# EasyEDA Pro project fei1554973967-sw3538-dff8db20.epro, board 充电板
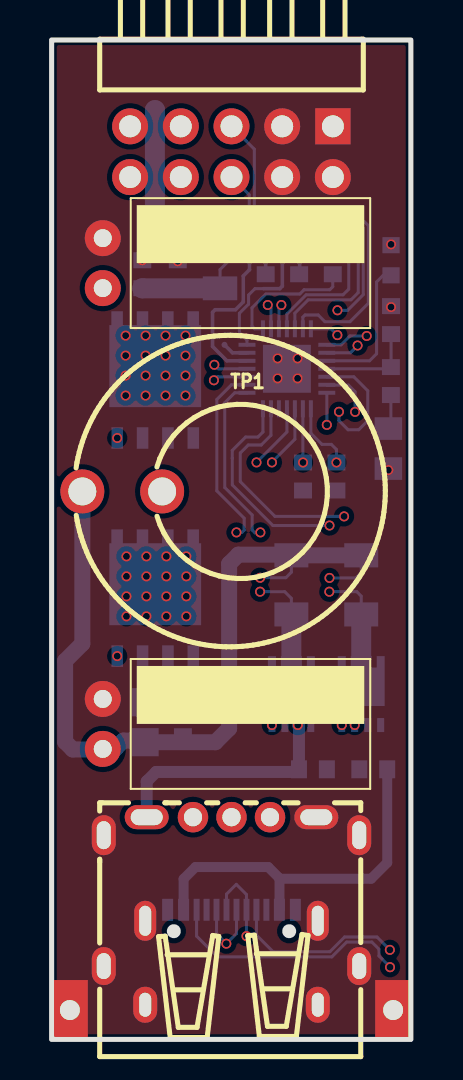
[diagram p3: board, top side]
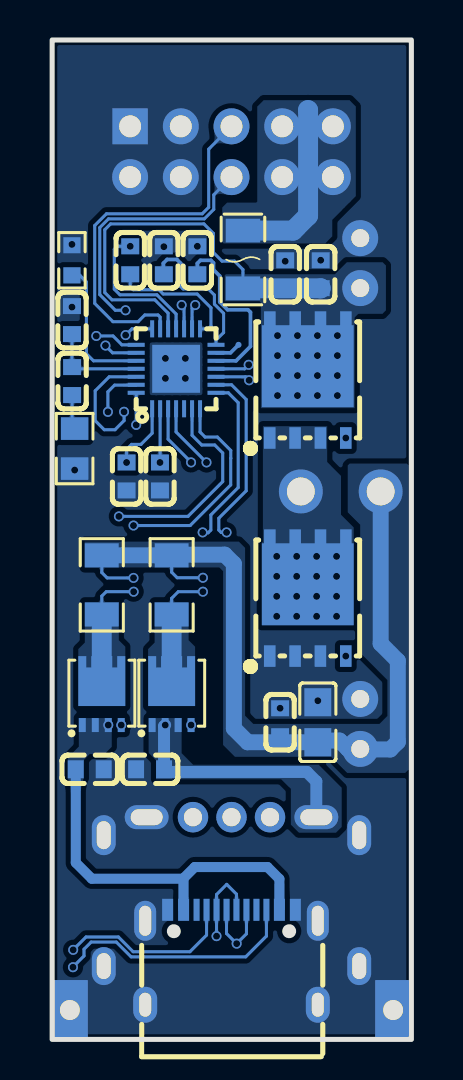
[diagram p4: board, bottom side, seen from below]

Outline 18 x 50 mm; copper layers: Top Layer, Inner1, Inner2, Bottom Layer. Coordinates in mm from the lower left corner of the outline.
Outline path: rectangle 0,50 18,0
Stack: Top Layer 0.035mm 外层铜厚1oz / Dielectric1 0.2104mm 7628 RC49% 8.6mil / Inner1 0.0152mm 内层铜厚 / Dielectric2 1.065mm 1.1mm H/HOZ Copper / Inner2 0.0152mm 内层铜厚 / Dielectric3 0.2104mm 7628 RC49% 8.6mil / Bottom Layer 0.035mm 外层铜厚1oz

## Design rules (mm)
spacing copperThickness1oz (default): track to track 0.1, other pairs 0 to 0.1
spacing copperThickness2oz: track to track 0.203, other pairs 0.152 to 0.3
spacing Plane_innerPlane: track to track 0.1, other pairs 0 to 0.1
spacing Copper_copperRegion: track to track 0.1, other pairs 0 to 0.1
track width copperThickness1oz (default): min 0.1, default 0.254, max 2.54
track width copperThickness2oz: min 0.203, default 0.254, max 2.54
differential pair differentialPair (default): width min 0.127, default 0.254, max 2.54; gap min 0.152, default 0.152
pour e543 uses Copper_copperRegion
pour e545 uses Copper_copperRegion
pour e547 uses Copper_copperRegion
pour e549 uses Copper_copperRegion

## Placement (name value [footprint] x y rotation side)
C1  330pF  [C0603]  14.27 28.16 270 bottom
C2  330pF  [C0603]  12.6 28.16 270 bottom
C3  100nF  [C0603]  4.54 38.28 90 bottom
C4  10uF  [C0603]  6.32 38.28 90 bottom
C5  220uF  [CAP-EL_D6.3X11MM-P2.5MM_W_DIP-X]  2.56 38.84 270 top
C6  100pF  [C0603]  17.01 35.99 90 bottom
C7  2.2nF  [C0603]  17 32.93 270 bottom
C8  10uF  [C0603]  16.12 13.51 0 bottom
C9  220uF  [CAP-EL_D6.3X11MM-P2.5MM_W_DIP-X]  2.56 15.78 270 top
C10  22uF  [C0805]  4.69 15.87 270 bottom
C11  100nF  [C0603]  6.58 15.87 270 bottom
C12  100nF  [C0603]  14.09 38.98 270 bottom
C13  10uF  [C0603]  13.09 13.51 180 bottom
C14  1uF  [C0603]  10.72 38.98 270 bottom
C15  1uF  [C0603]  12.4 38.98 270 bottom
F1  JFC1206-1500FS  [F1206]  8.44 39.02 90 bottom
H1  PZ254R-12-10P  [HDR-TH_10P-P2.54-H-M-R2-C5-S2.54]  9.01 44.41 180 top
L1  22uH  [IND-TH_BD15.5-P4.00-D0.8_XR050125TS221MHL5]  3.54 27.41 270 top
NOREF  -  [Pad_e80]  0.91 1.47 0 top
NOREF#2  -  [Pad_e81]  17.11 1.47 0 top
NTC1  SDNT1608X104F3950FTF  [R0603]  17.01 38.98 90 bottom
Q1  AON7544  [DFN-8_L3.3-W3.3-P0.65-BL-2]  15.51 16.49 180 bottom
Q2  AON6512  [PDFN-8_L5.6-W5.2-P1.27-LS6.1-BL]  5.19 32.99 180 bottom
Q3  AON6512  [PDFN-8_L5.6-W5.2-P1.27-LS6.1-BL]  5.19 22.08 180 bottom
Q4  AON7544  [DFN-8_L3.3-W3.3-P0.65-BL-2]  12.01 16.49 180 bottom
R1  20kΩ  [R0805]  16.87 29.56 270 bottom
TP1  -  [Test-Point-0.5mm]  8.66 34.75 0 top
U1  SW3538  [QFN-28_L4.0-W4.0-P0.40-TL-EP2.4]  11.79 33.55 90 bottom
U2  5mΩ  [R1206]  15.51 22.74 270 bottom
U3  5mΩ  [R1206]  12.01 22.74 270 bottom
USB1  TYPE-C 16PIN 2MD(073)  [USB-C-SMD_TYPE-C-6PIN-2MD-073]  9.01 4.11 180 bottom
USB2  U234-051N-3GRA035-5  [USB-A-TH_U234-051N-3GRA03]  9.01 7.39 0 top

## Footprints (pads in the part's own frame, mm; a bottom-side part is the same pattern mirrored in y, then rotated)
C0603
  rect 0.8x0.9 smd: 1(-0.7,0) 2(0.7,0)
C0805
  rect 1.41x1.35 smd: 1(-1,0) 2(1,0)
CAP-EL_D6.3X11MM-P2.5MM_W_DIP-X
  round 1.8 hole 0.9: 1(1.25,0) 2(-1.25,0)
DFN-8_L3.3-W3.3-P0.65-BL-2
  rect 0.35x0.7 smd: 1(-0.975,-0.765) 2(-0.325,-0.765) 3(0.325,-0.765) 4(0.975,-0.765)
  custom 2.352x2.498 smd: 5(0,0.765)
F1206
  rect 1.19x1.728 smd: 1(-1.445,0) 2(1.445,0)
HDR-TH_10P-P2.54-H-M-R2-C5-S2.54
  rect 1.778x1.8 hole 1.1: 1(-5.08,-1.27)
  round 1.8 hole 1.1: 2(-5.08,1.27) 3(-2.54,-1.27) 4(-2.54,1.27) 5(0,-1.27) 6(0,1.27) 7(2.54,-1.27) 8(2.54,1.27) 9(5.08,-1.27) 10(5.08,1.27)
IND-TH_BD15.5-P4.00-D0.8_XR050125TS221MHL5
  round 2.2 hole 1.4: 1(0,2) 2(0,-2)
Pad_e80
  rect 1.8x3 hole 1: 1(0,0)
Pad_e81
  rect 1.8x3 hole 1: 1(0,0)
PDFN-8_L5.6-W5.2-P1.27-LS6.1-BL
  rect 0.58x1.079 smd: 1(-1.907,-2.9) 2(-0.637,-2.9) 3(0.632,-2.9) 4(1.903,-2.9)
  rect 0.58x1.08 smd: 5(1.907,2.9) 6(0.637,2.9) 7(-0.632,2.9) 8(-1.903,2.9)
  rect 4.6x4.1 smd: 9(-0.003,0.695)
QFN-28_L4.0-W4.0-P0.40-TL-EP2.4
  rect 0.85x0.2 smd: 1(-2,1.2) 2(-2,0.8) 3(-2,0.4) 4(-2,0.001) 5(-2,-0.4) 6(-2,-0.8) 7(-2,-1.2) 15(2,-1.2) 16(2,-0.8) 17(2,-0.4) 18(2,0) 19(2,0.4) 20(2,0.8) 21(2,1.2)
  rect 0.2x0.85 smd: 8(-1.2,-2) 9(-0.8,-2) 10(-0.4,-2) 11(0,-2) 12(0.4,-2) 13(0.8,-2) 14(1.2,-2) 22(1.2,2) 23(0.8,2) 24(0.4,2) 25(0,2) 26(-0.4,2) 27(-0.8,2) 28(-1.2,2)
  rect 2.4x2.4 smd: 29(0,-0.001)
R0603
  rect 0.806x0.864 smd: 1(-0.753,0) 2(0.753,0)
R0805
  rect 1.133x1.377 smd: 1(-1,0) 2(1,0)
R1206
  rect 1.208x1.701 smd: 1(-1.479,0) 2(1.479,0)
Test-Point-0.5mm
  round 0.3 smd far side: 1(0,0)
USB-A-TH_U234-051N-3GRA03
  oval 2.2x1.2 hole 1.6x0.8: 1(-4.25,3.725) 5(4.25,3.725)
  round 1.524 hole 0.914: 2(-1.93,3.725) 3(0,3.725) 4(1.93,3.725)
  oval 1.2x2 hole 0.7x1.4: 6(-6.4,2.825) 7(6.4,2.825)
  oval 1.2x1.9 hole 0.7x1.3: 8(-6.4,-3.725) 9(6.4,-3.725)
USB-C-SMD_TYPE-C-6PIN-2MD-073
  rect 0.55x1.1 smd: 1(-3.2,2.375) 2(-2.4,2.375) 11(2.4,2.375) 12(3.2,2.375)
  rect 0.3x1.1 smd: 3(-1.75,2.375) 4(-1.25,2.375) 5(-0.75,2.375) 6(-0.25,2.375) 7(0.25,2.375) 8(0.75,2.375) 9(1.25,2.375) 10(1.75,2.375)
  oval 1.2x1.8 hole 0.6x1.2: 13(-4.325,-2.375) 14(4.325,-2.375)
  oval 1.1x2 hole 0.6x1.5: 13(-4.325,1.825) 14(4.325,1.825)

## Nets
As in the schematic, except:
GND: C1.2 C2.2 C3.2 C4.2 C5.2 C6.2 C8.1 C9.2 C10.1 C11.1 C13.1 C14.1 C15.1 H1.1 H1.2 H1.3 H1.4 NOREF.1 NOREF#2.1 NTC1.2 Q3.1 Q3.2 Q3.3 R1.2 U1.29 USB1.1 USB1.12 USB1.13 USB1.14 USB2.5 USB2.6 USB2.7 USB2.8 USB2.9

Pads without a net: U1 5; USB1 3 9

## Via types
v1: diameter 0.5, hole 0.35, Top Layer to Bottom Layer, 79 vias

## Routing (per net, layer and track width the routed paths; a pad name or vN(x,y) marks a point on that pad's centre or on a via; arc(x,y) is an arc through that point)
GND:
  vias: v1(4.54,38.98) v1(4.69,16.94) v1(6.32,38.93) v1(6.58,16.57) v1(10.72,39.68) v1(11.33,34.07) v1(11.33,33.07) v1(12.33,34.07) v1(12.33,33.07) v1(12.4,39.66) v1(16.87,28.48) v1(17.01,39.77) v1(17.01,36.64)
VBUSA: length 35.9
  Inner2 w0.152: Q4.2 12.34,15.73 12.35,15.73 12.35,16.14 12.14,16.34 8.48,16.34 7.7,17.12 7.7,33.29 8.15,33.75 v1(8.15,33.75)
  Bottom Layer w0.152: U1.11 8.35,33.55 v1(8.15,33.75)
  Bottom Layer w0.6: Q4.2 12.39,15.67 C13.2 12.26,13.38 5.24,13.38 4.76,12.91 USB2.1
  vias: v1(12.33,15.73)
VBUSC: length 44.5
  Inner2 w0.152: v1(8.13,32.97) 7.95,32.8 7.95,17.23 8.58,16.6 14.78,16.6 15.19,16.19 v1(15.19,15.73)
  Bottom Layer w0.152: v1(8.13,32.97) 8.3,33.15 U1.10
  Bottom Layer w0.5: 11.42,8.06 10.85,8.62 7.21,8.62 6.61,8.03 USB1.11 ; 11.42,8.06 11.44,8.04 16.01,8.04 16.82,8.84 C8.2 ; 11.42,8.06 11.42,6.49 USB1.2
VCC: length 8.9
  Bottom Layer w1: F1.2 5.92,40.46 5.18,41.21 5.18,46.49 5.18,46.49
VDD: length 9
  Bottom Layer w0.18: U1.12 8.78,33.95 8.06,34.67 8.06,36.38 8.19,36.5 9.21,36.5 9.6,36.89 9.6,38.19 9.92,38.51 9.92,38.85 10.04,38.97 10.57,38.97 10.72,38.82 C14.2
CC1: length 38.7
  Inner2 w0.152: v1(16.95,4.48) 17.19,4.73 17.19,25.53 14.5,28.23 13.18,28.23 12.6,28.81
  Bottom Layer w0.152: v1(12.6,28.86) 12.59,28.87 U1.2 ; USB1.4 10.26,5.22 11.09,4.39 13.94,4.39 14.68,5.12 16.3,5.12 v1(16.95,4.48)
CC2: length 42.7
  Inner2 w0.152: 14.27,28.81 17.45,25.64 17.45,4.08 16.97,3.61 v1(16.96,3.61)
  Bottom Layer w0.152: U1.1 12.99,30.33 13.55,29.77 14.02,29.77 14.27,29.51 v1(14.27,28.86) ; USB1.10 7.26,5.17 8.3,4.13 14.04,4.13 14.78,4.87 16.04,4.87 16.4,4.51 16.4,4.17 16.96,3.62 v1(16.96,3.61)
CSNA: length 18.6
  Inner2 w0.152: 10.47,22.4 9.97,22.9 9.97,23.22 10.46,23.71 v1(10.46,25.36)
  Bottom Layer w0.152: 10.46,25.34 10.19,25.34 10.05,25.48 10.05,26.24 8.68,27.61 8.68,31.85 9.17,32.35 U1.8 ; v1(10.44,22.4) 11.68,22.4 12.01,22.06 U3.2
  Bottom Layer w1: U3.2 Q4.5
CSNC: length 20.9
  Inner2 w0.152: v1(13.92,25.71) 13.92,23.8 13.42,23.3 13.42,22.89 v1(13.91,22.4)
  Bottom Layer w0.152: U1.7 10.59,30.39 10.34,30.14 9.72,30.14 9.05,29.46 9.05,29.08 9.05,29.07 9.05,27.74 11.08,25.71 v1(13.92,25.71) ; v1(13.91,22.4) 13.92,22.4 15.29,22.4 15.51,22.18 U2.2
  Bottom Layer w1: U2.2 Q1.5
CSPA: length 72.4
  Inner2 w0.152: 13.91,23.09 14.66,23.83 v1(14.66,26.16) ; v1(10.44,23.09) 10.92,23.09 11.15,22.87 11.15,22.05 10.81,21.71 9.51,21.71 9.26,21.96 v1(9.26,25.36)
  Bottom Layer w0.152: 13.91,23.09 v1(13.92,23.09) 15.24,23.09 15.51,23.36 U2.1 ; v1(14.66,26.16) 14.65,26.17 11.19,26.17 9.45,27.9 9.45,29.34 9.85,29.74 10.5,29.74 10.99,30.22 U1.6 ; v1(9.26,25.36) 9.53,25.36 9.65,25.48 9.65,26.07 8.28,27.44 8.28,32.01 9.01,32.75 U1.9 ; U3.1 12.01,23.37 11.74,23.1 10.45,23.1 v1(10.44,23.09)
  Bottom Layer w0.8: U2.1 U3.1 11.98,24.25 9.35,24.25 8.89,23.79 8.89,15.56 8.2,14.87 C10.2 4.6,14.95 3.6,14.95 3.18,14.53 C9.1 2.54,14.51 1.06,14.51 0.68,14.89 0.68,18.94 1.54,19.8 L1.2
DMC: length 43.1
  Inner2 w0.152: 9.76,5.16 10.54,4.38 13.94,4.38 14.68,5.12 16.41,5.12 16.69,5.4 16.69,25.32 14.29,27.72 11.41,27.72 v1(10.27,28.86)
  Bottom Layer w0.152: v1(10.27,28.86) 11.79,30.39 11.79,31.55 ; 9.76,5.16 v1(9.76,5.16) USB1.5 9.76,7.25 9.25,7.76 8.76,7.27 USB1.7
DPA: length 40.7
  Inner2 w0.152: USB2.4 10.94,13.5 11.23,13.79 15.29,13.79 16.19,14.69 16.19,16.39 15.23,17.35 8.89,17.35 8.71,17.54 8.71,29.78 9.16,30.23 12.71,30.23 13.02,29.92 14.87,29.92 15.21,30.26 v1(15.21,31.39)
  Bottom Layer w0.152: U1.27 13.81,32.73 14.87,32.73 15.21,32.4 v1(15.21,31.39)
DPC: length 43.3
  Inner2 w0.152: v1(11.04,28.86) 11.93,27.98 14.39,27.98 16.94,25.43 16.94,5.29 16.52,4.87 14.78,4.87 14.05,4.13 9.41,4.13 v1(8.75,4.79)
  Bottom Layer w0.152: 11.04,28.88 12.19,30.03 U1.3 ; USB1.6 9.26,5.3 v1(8.75,4.79) 8.26,5.28 USB1.8
GATEA: length 24.7
  Inner1 w0.152: v1(15.33,34.71) 15.33,32.28 15.8,31.81 15.8,31.06 15.36,30.62 15.36,17.91 14.68,17.24 11.48,17.24 11.03,16.78 11.03,15.73 v1(11.04,15.73)
  Bottom Layer w0.152: U1.23 14.97,34.35 15.33,34.7 v1(15.33,34.71)
GATEC: length 22.6
  Inner1 w0.152: v1(14.54,15.73) 14.54,16.71 15.61,17.78 15.61,30.52 16.05,30.96 16.05,31.91 15.58,32.38 15.58,34.2 15.79,34.4 v1(15.79,35.19)
  Bottom Layer w0.152: U1.22 14.51,34.75 14.95,35.19 v1(15.79,35.19)
HGATE: length 16.3
  Inner2 w0.152: v1(3.29,30.09) 3.28,30.09 3.28,31 2.66,31.63 2.66,35.61 3.23,36.18 10.96,36.18 v1(11.51,36.74)
  Bottom Layer w0.152: 11.51,36.73 11.39,36.61 U1.17
IDA: length 45.3
  Inner2 w0.152: v1(14.4,31.4) 14.4,30.54 14.03,30.17 13.12,30.17 12.81,30.48 9.06,30.48 8.46,29.88 8.46,17.43 8.79,17.1 15.12,17.1 15.94,16.28 15.94,14.79 15.19,14.04 9.3,14.04 9.01,13.75 USB2.3
  Bottom Layer w0.152: U1.26 15.14,33.15 15.84,32.45 15.84,30.95 15.39,30.5 14.85,30.5 14.4,30.96 14.4,31.4 v1(14.4,31.4)
LGATE: length 29.5
  Inner2 w0.152: v1(10.83,36.74) 10.85,36.74 11.37,37.26 12.29,37.26 12.48,37.06 12.48,36.33 12.08,35.93 7.73,35.93 7.45,35.65 7.45,20.5 7.05,20.1 3.53,20.1 3.28,19.86 3.28,19.18
  Bottom Layer w0.152: U1.16 10.99,36.58 v1(10.83,36.74)
  vias: v1(3.29,19.18)
MDA: length 41.3
  Inner2 w0.152: 13.8,30.74 8.96,30.74 8.2,29.99 8.2,17.33 8.68,16.85 15.02,16.85 15.69,16.18 15.69,14.9 15.08,14.29 7.41,14.29 7.08,13.96 USB2.2
  Bottom Layer w0.152: 13.8,30.74 v1(13.79,30.74) U1.28
SCL: length 15.7
  Inner2 w0.152: v1(14.32,36.48) 14.32,36.47 v1(14.32,35.23)
  Bottom Layer w0.152: v1(14.32,36.48) 14.83,36.48 15.62,37.26 15.62,40.61 15.18,41.05 10.38,41.05 9.9,41.52 9.9,42.25 H1.6 ; U1.21 14,35.55 14.31,35.23 v1(14.32,35.23)
SDA: length 18.9
  Bottom Layer w0.152: U1.20 12.59,36.14 12.69,36.24 13.36,36.24 13.69,35.91 14.95,35.91 15.87,36.82 15.87,40.72 15.28,41.3 10.48,41.3 10.16,41.63 10.16,44.54 H1.5
VDRV: length 7.4
  Bottom Layer w0.152: 10.62,37.56 10.19,37.56 9.87,37.24 9.87,36.78 9.41,36.32 9.41,35.36 9.79,34.98 U1.14
  Bottom Layer w0.18: 10.62,37.56 11.43,37.56 11.56,37.68 11.56,38.83 11.75,39.02 12.24,39.02 12.43,38.83 12.43,38.3 C15.2
$1N3322: length 30.8
  Inner2 w0.152: L1.1 3.93,29.02 2.81,29.02 2.41,29.43 2.41,35.72 3.12,36.43 8.16,36.43 9.82,38.09 12.5,38.09 v1(14.09,39.68)
  Bottom Layer w0.152: v1(14.09,39.68) 14.74,39.68 14.89,39.53 14.89,37.53 14.6,37.25 12.75,37.25 11.79,36.29 U1.18
  vias: v1(3.75,24.16) v1(3.75,23.16) v1(3.75,22.16) v1(3.75,21.16) v1(4.75,24.16) v1(4.75,23.16) v1(4.75,22.16) v1(4.75,21.16) v1(5.75,24.16) v1(5.75,23.16) v1(5.75,22.16) v1(5.75,21.16) v1(6.75,24.16) v1(6.75,23.16) v1(6.75,22.16) v1(6.75,21.16)
$1N3570: length 6.6
  Bottom Layer w0.152: C12.2 14.09,37.66 13.94,37.5 12.65,37.5 12.44,37.29 10.73,37.29 10.04,36.6 10.04,35.68 10.18,35.55 U1.15
$1N3598: length 1.7
  Bottom Layer w0.152: C7.2 17,30.68 R1.1
$1N3607: length 4.9
  Bottom Layer w0.152: U1.25 16.91,33.55 C7.1 17.01,33.64 C6.1
$1N3653: length 7.1
  Bottom Layer w0.152: NTC1.1 16.61,38.22 16.28,37.89 16.28,34.3 15.93,33.95 U1.24
$1N3771: length 20.9
  Bottom Layer w0.152: U1.19 12.19,36.33 12.86,37 15,37 15.36,37.36 15.36,40.51 15.07,40.8 10.39,40.8 9.92,40.32 9.92,39.37 9.49,38.93 8.86,38.93 8.44,38.51 F1.1
  Bottom Layer w1: C3.1 4.55,37.57 F1.1
  vias: v1(3.71,35.21) v1(3.71,34.21) v1(3.71,33.21) v1(3.71,32.21) v1(4.71,35.21) v1(4.71,34.21) v1(4.71,33.21) v1(4.71,32.21) v1(5.71,35.21) v1(5.71,34.21) v1(5.71,33.21) v1(5.71,32.21) v1(6.71,35.21) v1(6.71,34.21) v1(6.71,33.21) v1(6.71,32.21)
$1N9417: length 1.3
  Bottom Layer w0.18: U1.13 9.06,34.35 TP1.1

## Copper pours and planes (outline as drawn; the poured copper is in the pictures)
GND on Top Layer: -4.95,52.32 29.11,52.32 29.11,-7.85 -4.95,-7.85
GND on Bottom Layer: -2.31,51.82 28.5,51.82 28.5,-6.57 -2.31,-6.57
GND on Inner1: -2.56,51.24 25.98,51.24 25.98,-1.74 -2.56,-1.74
GND on Inner2: -7.39,53.77 33.37,53.77 33.37,-7.43 -7.39,-7.43
VBUSA on Bottom Layer: 3.49,16.08 13.16,16.08 13.16,10.34 3.49,10.34
VBUSC on Bottom Layer: 15.01,16.08 17.22,16.08 17.22,13.06 15.01,13.06
VCC on Bottom Layer: 2.78,46.99 9.48,46.99 9.48,39.82 2.78,39.82
CSNA on Bottom Layer: 10.84,21.86 13.19,21.86 13.19,16.67 10.84,16.67
CSNC on Bottom Layer: 14.34,21.86 16.69,21.86 16.69,16.67 14.34,16.67
CSPA on Bottom Layer: 0.13,28.81 16.37,28.81 16.37,13.33 0.13,13.33
$1N3322 on Bottom Layer: 2.89,30.68 7.49,30.68 7.49,20.72 2.89,20.72
$1N3771 on Bottom Layer: 1.28,38.88 9.35,38.88 9.35,31.58 1.28,31.58

Small or netless copper shapes (teardrops, artwork), in the pictures only: 96 on Bottom Layer, 4 on Inner1, 34 on Inner2
